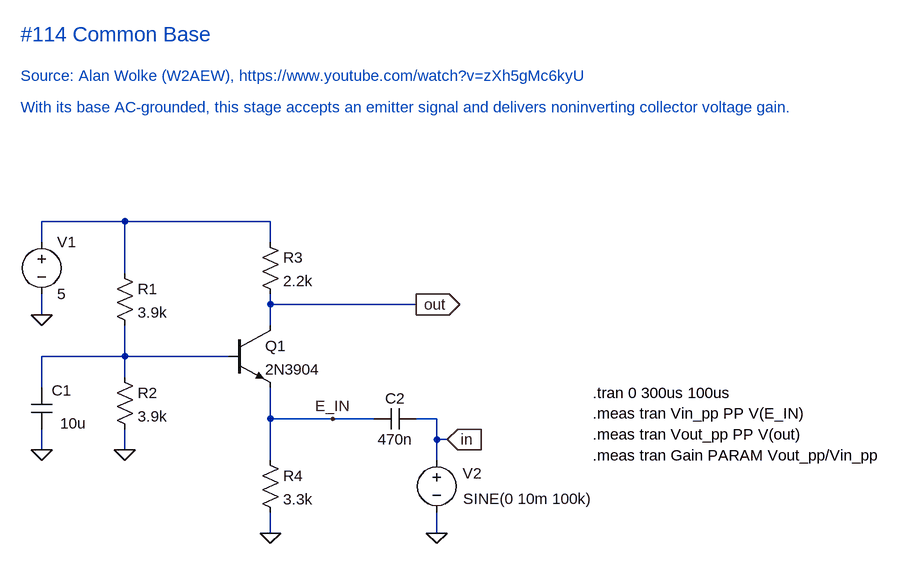
[diagram p0: schematic Common Base.asc]
Common Base.asc, the LTspice schematic file:
Version 4.1
SHEET 1 1560 680
WIRE 480 -112 352 -112
WIRE 704 -112 480 -112
WIRE 352 -80 352 -112
WIRE 704 -80 704 -112
WIRE 480 -32 480 -112
WIRE 704 16 704 0
WIRE 928 16 704 16
WIRE 352 32 352 0
WIRE 704 48 704 16
WIRE 480 96 480 48
WIRE 480 96 352 96
WIRE 640 96 480 96
WIRE 480 128 480 96
WIRE 352 144 352 96
WIRE 704 192 704 144
WIRE 800 192 704 192
WIRE 864 192 800 192
WIRE 960 192 928 192
WIRE 960 224 960 192
WIRE 976 224 960 224
WIRE 352 240 352 208
WIRE 480 240 480 208
WIRE 704 256 704 192
WIRE 960 256 960 224
WIRE 704 368 704 336
WIRE 960 368 960 336
FLAG 352 32 0
FLAG 352 240 0
FLAG 704 368 0
FLAG 480 240 0
FLAG 976 224 in
FLAG 800 192 E_IN
IOPIN 976 224 In
FLAG 960 368 0
SYMBOL voltage 352 -96 R0
WINDOW 123 0 0 Left 0
WINDOW 39 0 0 Left 0
SYMATTR InstName V1
SYMATTR Value 5
SYMBOL voltage 960 240 R0
WINDOW 3 41 75 Left 2
WINDOW 123 0 0 Left 0
WINDOW 39 0 0 Left 0
WINDOW 0 40 36 Left 2
SYMATTR Value SINE(0 10m 100k)
SYMATTR InstName V2
SYMBOL res 464 -48 R0
SYMATTR InstName R1
SYMATTR Value 3.9k
SYMBOL res 464 112 R0
SYMATTR InstName R2
SYMATTR Value 3.9k
SYMBOL npn 640 48 R0
SYMATTR InstName Q1
SYMATTR Value 2N3904
SYMBOL res 688 -96 R0
SYMATTR InstName R3
SYMATTR Value 2.2k
SYMBOL res 688 240 R0
SYMATTR InstName R4
SYMATTR Value 3.3k
SYMBOL cap 368 208 R180
WINDOW 0 -30 60 Left 2
WINDOW 3 -53 9 Left 2
SYMATTR InstName C1
SYMATTR Value 10u
SYMBOL cap 928 176 R90
WINDOW 0 0 32 VBottom 2
WINDOW 3 32 32 VTop 2
SYMATTR InstName C2
SYMATTR Value 470n
FLAG 928 16 out
IOPIN 928 16 Out
TEXT 1200 152 Left 2 !.tran 0 300us 100us
TEXT 1200 184 Left 2 !.meas tran Vin_pp PP V(E_IN)
TEXT 1200 216 Left 2 !.meas tran Vout_pp PP V(out)
TEXT 1200 248 Left 2 !.meas tran Gain PARAM Vout_pp/Vin_pp
TEXT 320 -400 Left 3 ;#114 Common Base
TEXT 320 -336 Left 2 ;Source: Alan Wolke (W2AEW), https://www.youtube.com/watch?v=zXh5gMc6kyU
TEXT 320 -288 Left 2 ;With its base AC-grounded, this stage accepts an emitter signal and delivers noninverting collector voltage gain.

The netlist it stands for:
* Common Base.asc
V1 N001 0 5
V2 in 0 SINE(0 10m 100k)
R1 N001 N002 3.9k
R2 N002 0 3.9k
Q1 out N002 E_IN 0 2N3904
R3 N001 out 2.2k
R4 E_IN 0 3.3k
C1 0 N002 10u
C2 in E_IN 470n
.model NPN NPN
.model PNP PNP
.lib standard.bjt
.tran 0 300us 100us
.meas tran Vin_pp PP V(E_IN)
.meas tran Vout_pp PP V(out)
.meas tran Gain PARAM Vout_pp/Vin_pp
* #114 Common Base
* Source: Alan Wolke (W2AEW), https://www.youtube.com/watch?v=zXh5gMc6kyU
* With its base AC-grounded, this stage accepts an emitter signal and delivers noninverting collector voltage gain.
.backanno
.end